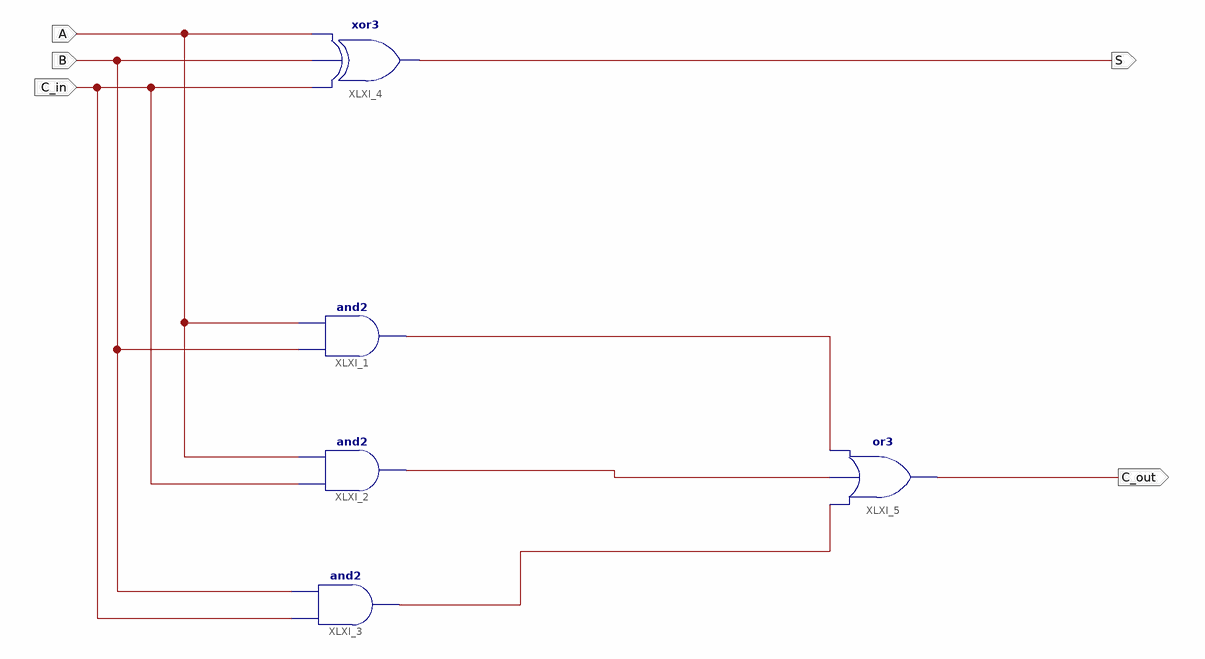
[diagram p0: schematic sheet 1]
// Xilinx ISE schematic full_adder.sch (spartan3e) as structural Verilog: 5 symbols, 5 ports
module full_adder (
  input  A,
  input  C_in,
  input  B,
  output S,
  output C_out
);

  wire XLXN_8, XLXN_9, XLXN_11;

  and XLXI_1 (XLXN_8, B, A);
  and XLXI_2 (XLXN_9, C_in, A);
  and XLXI_3 (XLXN_11, C_in, B);
  xor XLXI_4 (S, C_in, B, A);
  or XLXI_5 (C_out, XLXN_11, XLXN_9, XLXN_8);
endmodule
